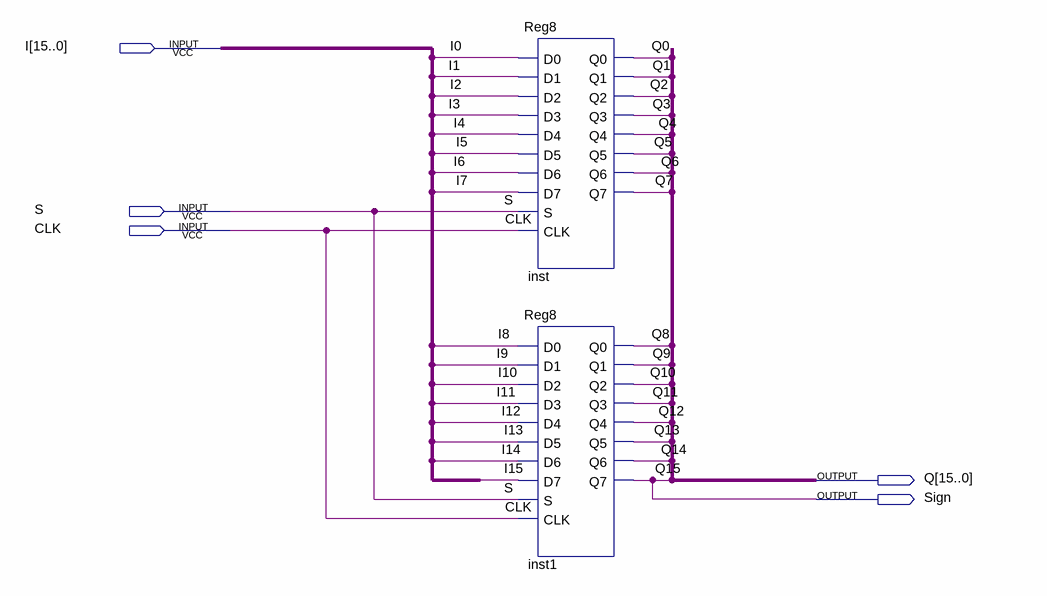
[diagram p0: schematic sheet]
// Quartus schematic Reg16_Sign.bdf as structural Verilog: 2 symbols, 5 pins
module Reg16_Sign (
  input  [15:0] I,
  input  S,
  input  CLK,
  output [15:0] Q,
  output Sign
);

  Reg8 inst (
    .D0(I[0]), .D1(I[1]), .D2(I[2]), .D3(I[3]), .D4(I[4]), .D5(I[5]), .D6(I[6]), .D7(I[7]), .S(S), .CLK(CLK),
    .Q0(Q[0]), .Q1(Q[1]), .Q2(Q[2]), .Q3(Q[3]), .Q4(Q[4]), .Q5(Q[5]), .Q6(Q[6]), .Q7(Q[7]));
  Reg8 inst1 (
    .D0(I[8]), .D1(I[9]), .D2(I[10]), .D3(I[11]), .D4(I[12]), .D5(I[13]), .D6(I[14]), .D7(I[15]), .S(S),
    .CLK(CLK), .Q0(Q[8]), .Q1(Q[9]), .Q2(Q[10]), .Q3(Q[11]), .Q4(Q[12]), .Q5(Q[13]), .Q6(Q[14]), .Q7(Q[15]));

  assign Sign = Q[15];
endmodule
